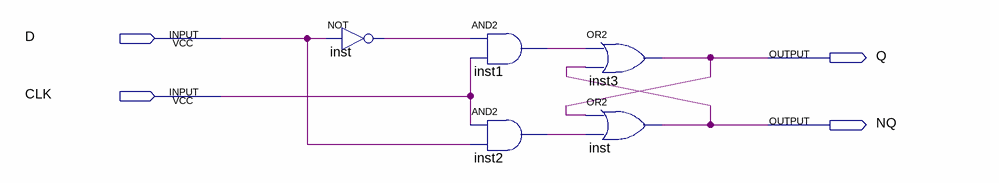
[diagram p0: schematic sheet]
// Quartus schematic D_flip_flop.bdf as structural Verilog: 5 symbols, 4 pins
module D_flip_flop (
  input  D,
  input  CLK,
  output Q,
  output NQ
);

  wire inst1_out, inst2_out, inst_out;

  not inst (inst_out, D);
  and inst1 (inst1_out, inst_out, CLK);
  and inst2 (inst2_out, CLK, D);
  or inst3 (Q, inst1_out, NQ);
  or inst_dup2 (NQ, Q, inst2_out);
endmodule
